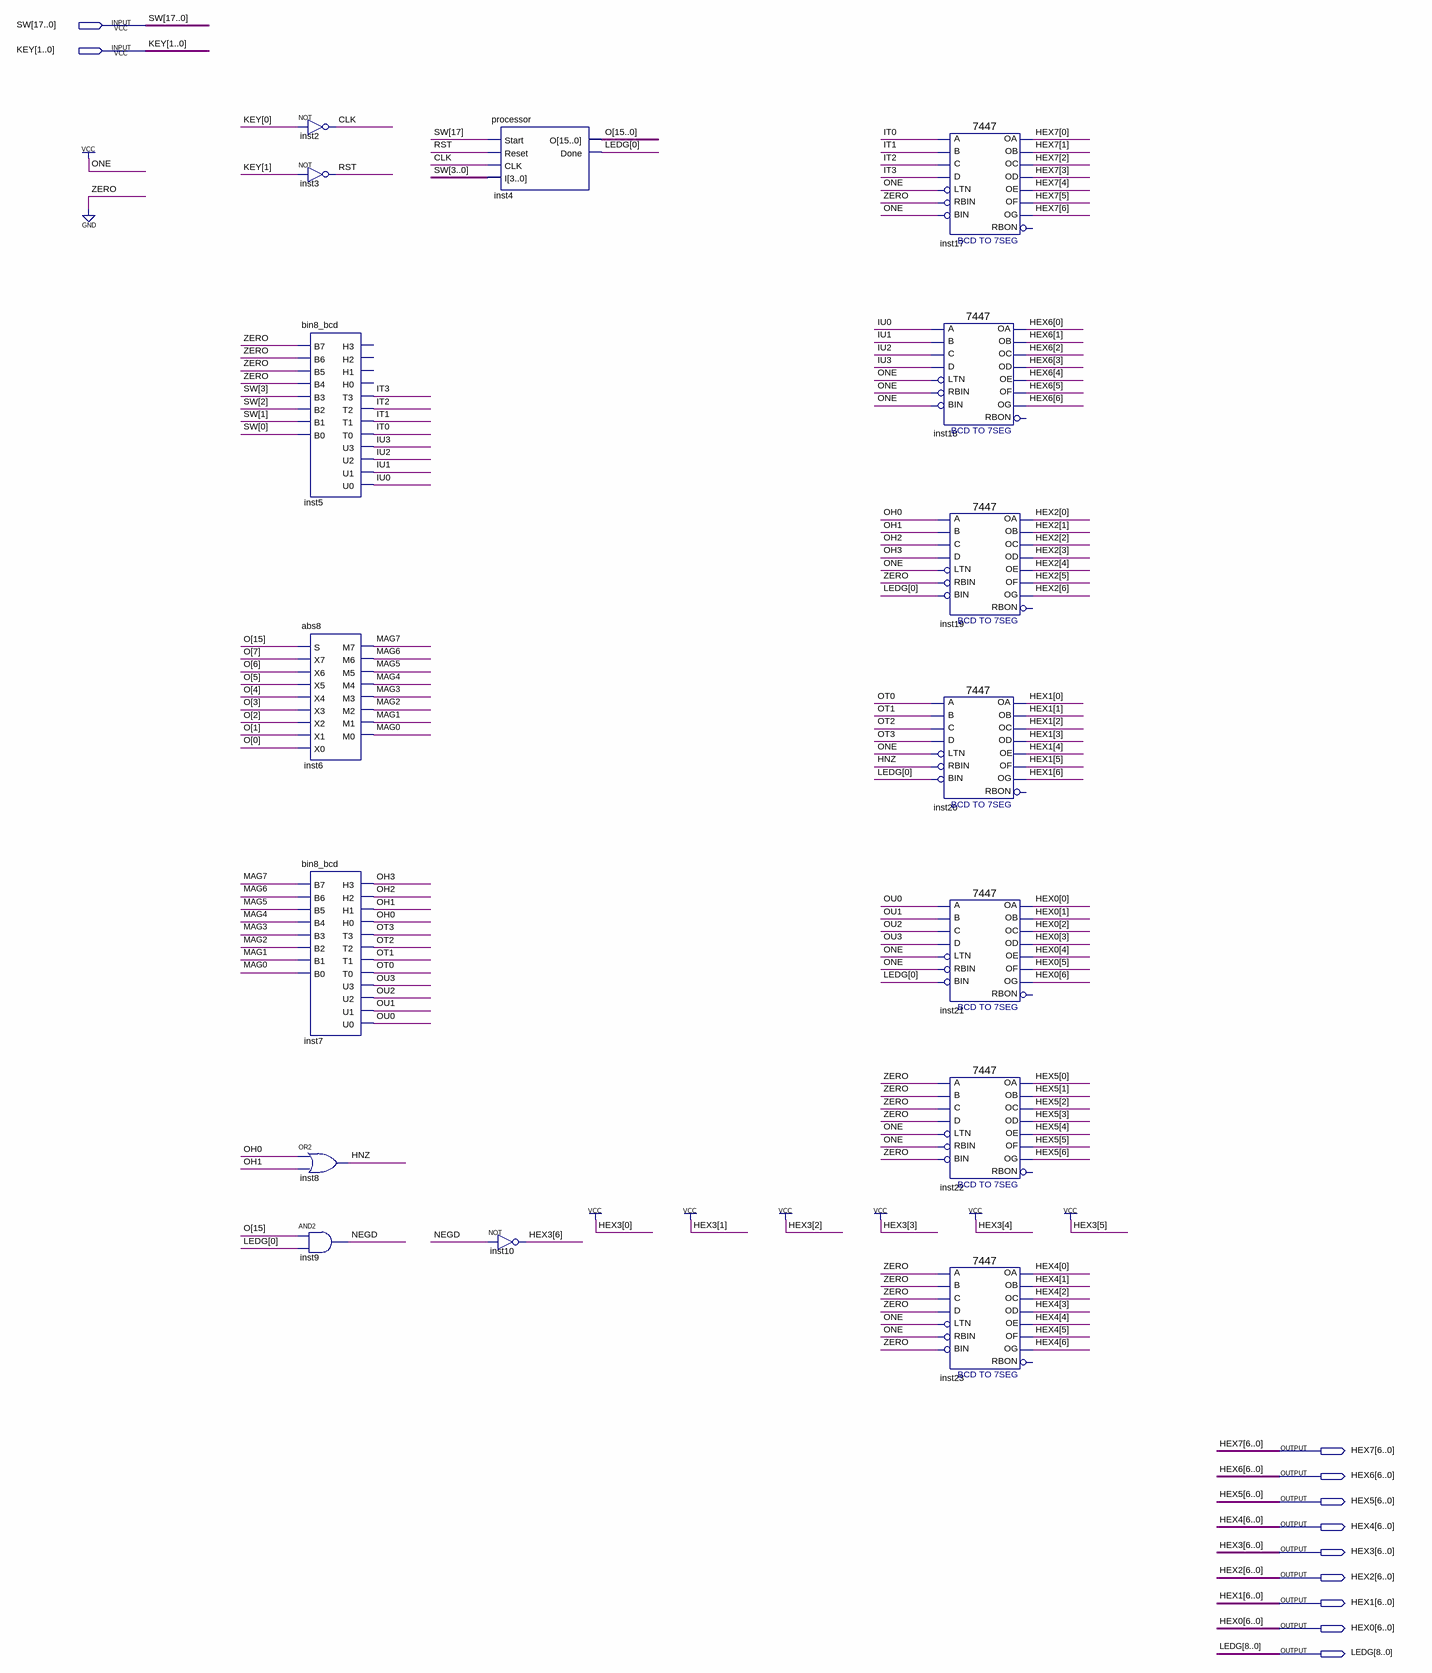
[diagram p0: schematic sheet]
// Quartus schematic lab4_5_de2.bdf as structural Verilog: 16 symbols, 11 pins
module lab4_5_de2 (
  input  [17:0] SW,
  input  [1:0] KEY,
  output [6:0] HEX7,
  output [6:0] HEX6,
  output [6:0] HEX5,
  output [6:0] HEX4,
  output [6:0] HEX3,
  output [6:0] HEX2,
  output [6:0] HEX1,
  output [6:0] HEX0,
  output [8:0] LEDG
);

  wire CLK, HNZ, IT0, IT1, IT2, IT3, IU0, IU1, IU2, IU3, MAG0, MAG1, MAG2, MAG3, MAG4, MAG5, MAG6, MAG7,
       NEGD, OH0, OH1, OH2, OH3, OT0, OT1, OT2, OT3, OU0, OU1, OU2, OU3, RST;
  wire [15:0] O;

  not inst2 (CLK, KEY[0]);
  not inst3 (RST, KEY[1]);
  bin8_bcd inst5 (
    .B7(1'b0), .B6(1'b0), .B5(1'b0), .B4(1'b0), .B3(SW[3]), .B2(SW[2]), .B1(SW[1]), .B0(SW[0]), .T3(IT3),
    .T2(IT2), .T1(IT1), .T0(IT0), .U3(IU3), .U2(IU2), .U1(IU1), .U0(IU0));  // open: H3, H2, H1, H0
  abs8 inst6 (
    .S(O[15]), .X7(O[7]), .X6(O[6]), .X5(O[5]), .X4(O[4]), .X3(O[3]), .X2(O[2]), .X1(O[1]), .X0(O[0]),
    .M7(MAG7), .M6(MAG6), .M5(MAG5), .M4(MAG4), .M3(MAG3), .M2(MAG2), .M1(MAG1), .M0(MAG0));
  bin8_bcd inst7 (
    .B7(MAG7), .B6(MAG6), .B5(MAG5), .B4(MAG4), .B3(MAG3), .B2(MAG2), .B1(MAG1), .B0(MAG0), .H3(OH3),
    .H2(OH2), .H1(OH1), .H0(OH0), .T3(OT3), .T2(OT2), .T1(OT1), .T0(OT0), .U3(OU3), .U2(OU2), .U1(OU1),
    .U0(OU0));
  or inst8 (HNZ, OH0, OH1);
  and inst9 (NEGD, O[15], LEDG[0]);
  processor inst4 (.Start(SW[17]), .Reset(RST), .CLK(CLK), .I(SW[3:0]), .O(O), .Done(LEDG[0]));
  not inst10 (HEX3[6], NEGD);
  \7447  inst17 (
    .LTN(1'b1), .B(IT1), .C(IT2), .D(IT3), .RBIN(1'b0), .BIN(1'b1), .A(IT0), .OB(HEX7[1]), .OC(HEX7[2]),
    .OE(HEX7[4]), .OD(HEX7[3]), .OF(HEX7[5]), .OG(HEX7[6]), .OA(HEX7[0]));  // open: RBON
  \7447  inst18 (
    .LTN(1'b1), .B(IU1), .C(IU2), .D(IU3), .RBIN(1'b1), .BIN(1'b1), .A(IU0), .OB(HEX6[1]), .OC(HEX6[2]),
    .OE(HEX6[4]), .OD(HEX6[3]), .OF(HEX6[5]), .OG(HEX6[6]), .OA(HEX6[0]));  // open: RBON
  \7447  inst19 (
    .LTN(1'b1), .B(OH1), .C(OH2), .D(OH3), .RBIN(1'b0), .BIN(LEDG[0]), .A(OH0), .OB(HEX2[1]), .OC(HEX2[2]),
    .OE(HEX2[4]), .OD(HEX2[3]), .OF(HEX2[5]), .OG(HEX2[6]), .OA(HEX2[0]));  // open: RBON
  \7447  inst20 (
    .LTN(1'b1), .B(OT1), .C(OT2), .D(OT3), .RBIN(HNZ), .BIN(LEDG[0]), .A(OT0), .OB(HEX1[1]), .OC(HEX1[2]),
    .OE(HEX1[4]), .OD(HEX1[3]), .OF(HEX1[5]), .OG(HEX1[6]), .OA(HEX1[0]));  // open: RBON
  \7447  inst21 (
    .LTN(1'b1), .B(OU1), .C(OU2), .D(OU3), .RBIN(1'b1), .BIN(LEDG[0]), .A(OU0), .OB(HEX0[1]), .OC(HEX0[2]),
    .OE(HEX0[4]), .OD(HEX0[3]), .OF(HEX0[5]), .OG(HEX0[6]), .OA(HEX0[0]));  // open: RBON
  \7447  inst22 (
    .LTN(1'b1), .B(1'b0), .C(1'b0), .D(1'b0), .RBIN(1'b1), .BIN(1'b0), .A(1'b0), .OB(HEX5[1]), .OC(HEX5[2]),
    .OE(HEX5[4]), .OD(HEX5[3]), .OF(HEX5[5]), .OG(HEX5[6]), .OA(HEX5[0]));  // open: RBON
  \7447  inst23 (
    .LTN(1'b1), .B(1'b0), .C(1'b0), .D(1'b0), .RBIN(1'b1), .BIN(1'b0), .A(1'b0), .OB(HEX4[1]), .OC(HEX4[2]),
    .OE(HEX4[4]), .OD(HEX4[3]), .OF(HEX4[5]), .OG(HEX4[6]), .OA(HEX4[0]));  // open: RBON

  assign HEX3[5:0] = {6{1'b1}};
endmodule
